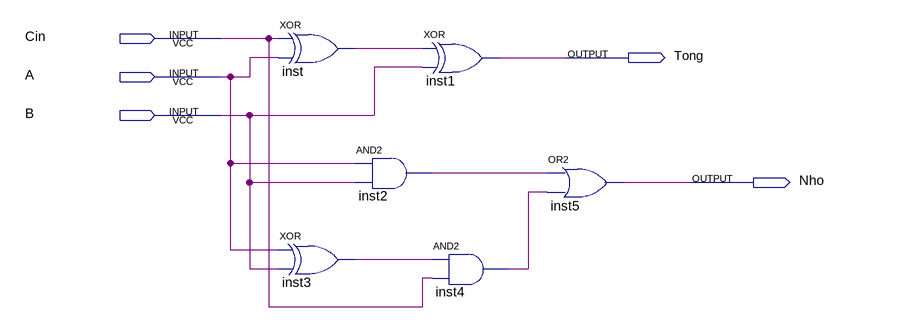
[diagram p0: schematic sheet]
// Quartus schematic FullAdder.bdf as structural Verilog: 6 symbols, 5 pins
module FullAdder (
  input  Cin,
  input  A,
  input  B,
  output Tong,
  output Nho
);

  wire inst2_out, inst3_out, inst4_out, inst_out;

  xor inst (inst_out, Cin, A);
  xor inst3 (inst3_out, A, B);
  and inst2 (inst2_out, A, B);
  xor inst1 (Tong, inst_out, B);
  and inst4 (inst4_out, inst3_out, Cin);
  or inst5 (Nho, inst2_out, inst4_out);
endmodule
